# Altium schematic sheet Hdr2.SchDoc
size Letter; SheetNumber: 9; SheetTotal: 15
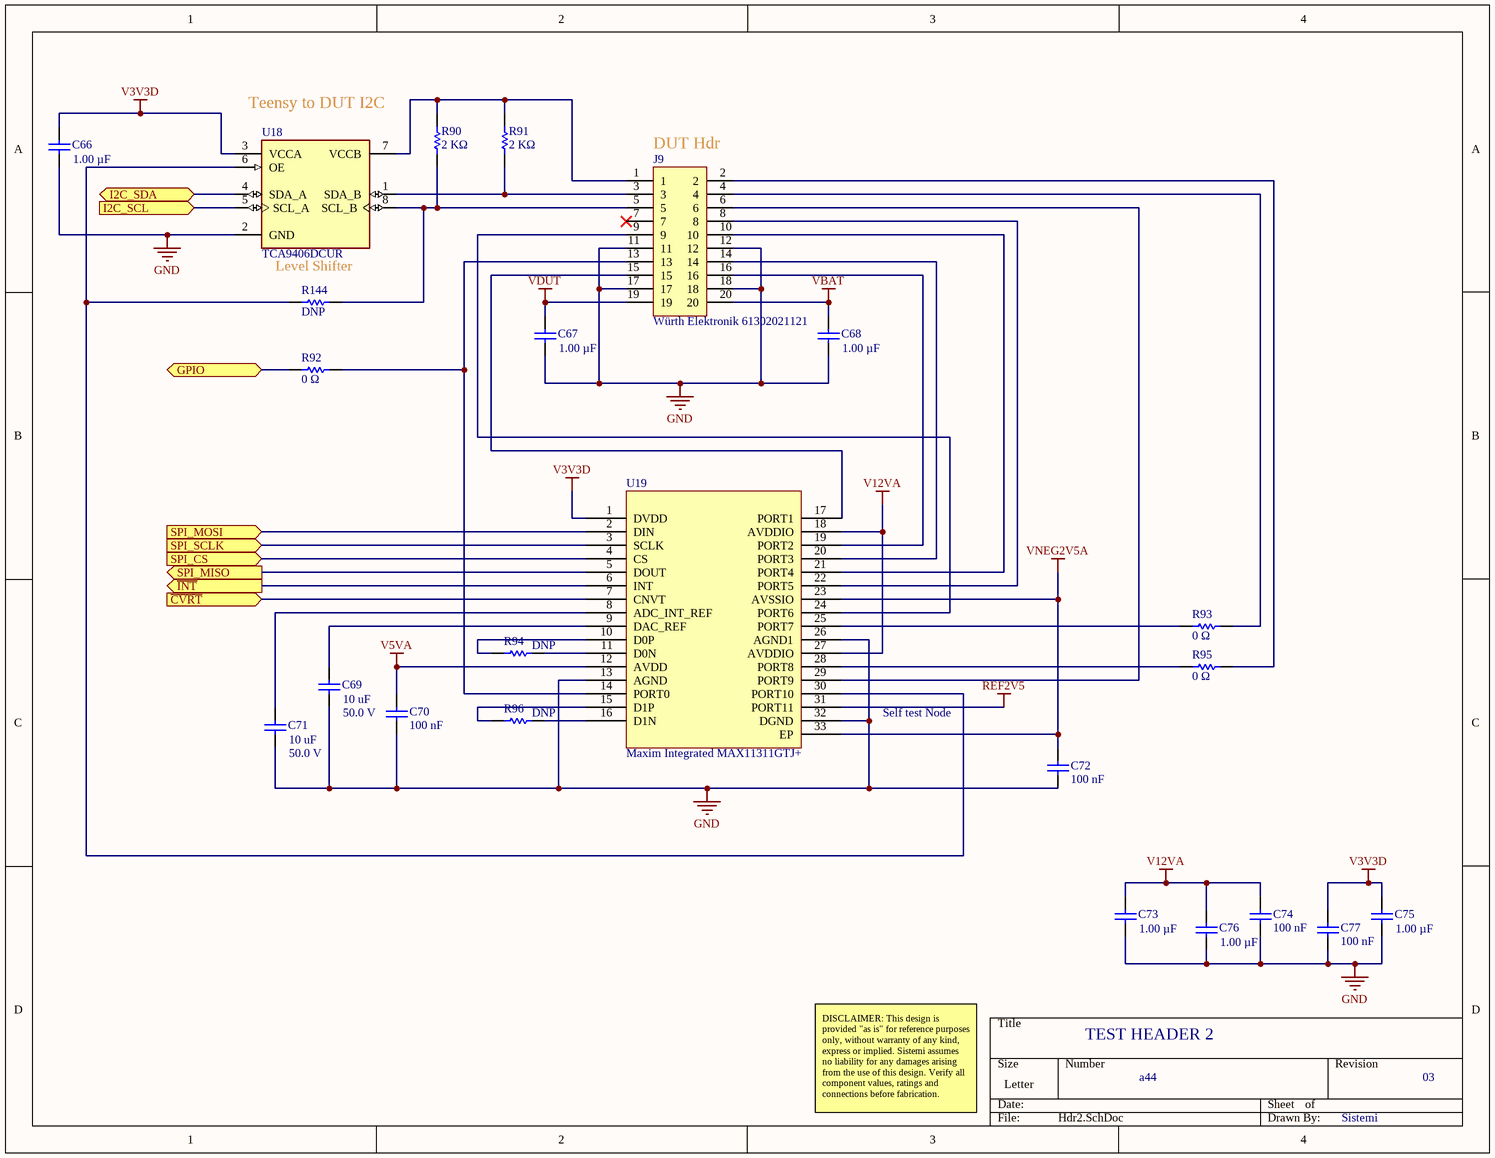
[diagram p0: Hdr2.SchDoc]

## Parts
C66  Capacitance: 1.00 µF  [CAPC1608X90X35NL15T15]  (hidden comment: Samsung CL10B105KA8NNNC)
C67  Capacitance: 1.00 µF  [CAPC1608X90X35NL15T15]  (hidden comment: Samsung CL10B105KA8NNNC)
C68  Capacitance: 1.00 µF  [CAPC1608X90X35NL15T15]  (hidden comment: Samsung CL10B105KA8NNNC)
C69  Capacitance: 10 uF  Voltage Rating (DC): 50.0 V  [CAPC3216X180X55LL20T25]  (hidden comment: Murata GRM31CR61H106KA12L)
C70  Capacitance: 100 nF  [CAPC1005X56X25NL10T15]  (hidden comment: Samsung CL05B104KO5NNNC)
C71  Capacitance: 10 uF  Voltage Rating (DC): 50.0 V  [CAPC3216X180X55LL20T25]  (hidden comment: Murata GRM31CR61H106KA12L)
C72  Capacitance: 100 nF  [CAPC1005X56X25NL10T15]  (hidden comment: Samsung CL05B104KO5NNNC)
C73  Capacitance: 1.00 µF  [CAPC1608X90X35NL15T15]  (hidden comment: Samsung CL10B105KA8NNNC)
C74  Capacitance: 100 nF  [CAPC1005X56X25NL10T15]  (hidden comment: Samsung CL05B104KO5NNNC)
C75  Capacitance: 1.00 µF  [CAPC1608X90X35NL15T15]  (hidden comment: Samsung CL10B105KA8NNNC)
C76  Capacitance: 1.00 µF  [CAPC1608X90X35NL15T15]  (hidden comment: Samsung CL10B105KA8NNNC)
C77  Capacitance: 100 nF  [CAPC1005X56X25NL10T15]  (hidden comment: Samsung CL05B104KO5NNNC)
J9  Würth Elektronik 61302021121  [PCB-nk6cd1c3p7lqby8wsdwb-1]
R90  Resistance: 2 KΩ  [RESC1608X55X30ML15T15]  (hidden comment: Generic RES 0603)
R91  Resistance: 2 KΩ  [RESC1608X55X30ML15T15]  (hidden comment: Generic RES 0603)
R92  Resistance: 0 Ω  [RESC1608X55X30ML15T15]  (hidden comment: Generic RES 0603)
R93  Resistance: 0 Ω  [RESC1608X55X30ML15T15]  (hidden comment: Generic RES 0603)
R94  Resistance: DNP  [RESC1608X55X30ML15T15]  (hidden comment: Generic RES 0603)
R95  Resistance: 0 Ω  [RESC1608X55X30ML15T15]  (hidden comment: Generic RES 0603)
R96  Resistance: DNP  [RESC1608X55X30ML15T15]  (hidden comment: Generic RES 0603)
R144  Resistance: DNP  [RESC1608X55X30ML15T15]  (hidden comment: Generic RES 0603)
U18  TCA9406DCUR  [DCU8_L]
U19  Maxim Integrated MAX11311GTJ+  [PCB-s1hzzxkmij8s4b201del-1]

## Ports
GPIO (bidir), I2C_SCL (in), I2C_SDA (bidir), SPI_CS (in), SPI_MISO (out), SPI_MOSI (in), SPI_SCLK (in), ~{CVRT} (in), ~{INT} (out)

## Nets
GND: C66.1 C67.1 C68.1 C69.1 C70.2 C71.1 C72.2 C73.1 C74.2 C75.1 C76.1 C77.2 J9.11 J9.12 J9.17 J9.18 U18.2(GND) U19.13(AGND) U19.26(AGND1) U19.32(DGND)
REF2V5: U19.31(PORT11)
V3V3D: C66.2 C75.2 C77.1 U18.3(VCCA) U19.1(DVDD)
V5VA: C70.1 U19.12(AVDD)
V12VA: C73.2 C74.1 C76.2 U19.18(AVDDIO) U19.27(AVDDIO)
VBAT: C68.2 J9.20
VDUT: C67.2 J9.19
VNEG2V5A: C72.1 U19.23(AVSSIO) U19.33(EP)
~{CVRT}: U19.7(CNVT) ; port ~{CVRT}
GPIO: R92.2 ; port GPIO
I2C_SCL: U18.5(SCL_A) ; port I2C_SCL
I2C_SDA: U18.4(SDA_A) ; port I2C_SDA
~{INT}: U19.6(INT) ; port ~{INT}
SPI_CS: U19.4(CS) ; port SPI_CS
SPI_MISO: U19.5(DOUT) ; port SPI_MISO
SPI_MOSI: U19.2(DIN) ; port SPI_MOSI
SPI_SCLK: U19.3(SCLK) ; port SPI_SCLK
NetC69_2: C69.2 U19.9(DAC_REF)
NetC71_2: C71.2 U19.8(ADC_INT_REF)
NetJ9_1: J9.1 R90.1 R91.1 U18.7(VCCB)
NetJ9_2: J9.2 R95.1
NetJ9_3: J9.3 R91.2 U18.1(SDA_B)
NetJ9_4: J9.4 R93.1
NetJ9_5: J9.5 R90.2 R144.1 U18.8(SCL_B)
NetJ9_6: J9.6 U19.29(PORT9)
NetJ9_8: J9.8 U19.22(PORT5)
NetJ9_9: J9.9 U19.24(PORT6)
NetJ9_10: J9.10 U19.21(PORT4)
NetJ9_13: J9.13 R92.1 U19.14(PORT0)
NetJ9_14: J9.14 U19.20(PORT3)
NetJ9_15: J9.15 U19.17(PORT1)
NetJ9_16: J9.16 U19.19(PORT2)
NetR93_2: R93.2 U19.25(PORT7)
NetR94_1: R94.1 U19.11(D0N)
NetR94_2: R94.2 U19.10(D0P)
NetR95_2: R95.2 U19.28(PORT8)
NetR96_1: R96.1 U19.16(D1N)
NetR96_2: R96.2 U19.15(D1P)
NetR144_2: R144.2 U18.6(OE) U19.30(PORT10)

Not connected (* = marked no-connect by the designer): J9 7*

## Notes on the sheet
- Teensy to DUT I2C
- (near J9) DUT Hdr
- Level Shifter
- Self test Node
- TEST HEADER 2
- DISCLAIMER: This design is provided "as is" for reference purposes only, without warranty of any kind, express or implied. Sistemi assumes no liability for any damages arising from the use of this design. Verify all component values, ratings and connections before fabrication.
- a44
- 03
- Sistemi

## Library data of the parts
C66-C68 C73 C75 C76 = CMP-7473528-5: CL Series 0603 1 uF 25 V ±10 % X7R Surface Mount Multilayer Ceramic Capacitor; Manufacturer Part Number: UMK107AB7105KA-T; Lead-Free Status: Lead Free; Capacitance Tolerance: ±10%; Voltage Rating (DC): 25.0 V; RoHS: Compliant; Mounting Style: Surface Mount; Footprint: PCB-0002-00062-3; Octopart URL: http://octopart.com/cl10b105ka8nnnc-samsung-19831597; Case/Package: 0603; OctopartID: ce7a065e703111bd; Dielectric Characteristic: X7R
C69 C71 = CMP-3554908-2: Multilayer Ceramic Capacitors MLCC - SMD/SMT 1206 10uF 50volt X5R +/-10%; Manufacturer Part Number: CL31B106KBHNNNE; Capacitance Tolerance: ±10%; Case/Package (SI): 3216; Lead-Free Status: Lead Free; Dielectric Characteristic: X5R; Lifecycle Status: Active; Mounting Style: Surface Mount; Number of Pins: 2; Octopart Url: https://octopart.com/grm31cr61h106ka12l-murata-18903335; OctopartID: fd8535afa9c42242; Packaging: Cut Tape (CT); REACH SVHC Compliance: No SVHC; RoHS: Compliant; Size-Length: 0.0032 m; Size-Thickness: 0.0016 m; Size-Width: 0.0016 m
C70 C72 C74 C77 = CMP-bf2276a55d9a60e5-19: Ceramic capacitor SMD-0402 100nF /16V X7R# K +-10%, Samsung, RoHS; Dielectric Characteristic: X7R; Lead-Free Status: Lead Free; Voltage Rating (DC): 16.0 V; Capacitance Tolerance: ±10%; Mounting Style: Surface Mount; Case/Package: 0402; OctopartID: 0755ced2c795d892; Footprint: PCB-0002-00476-3; Octopart URL: https://octopart.com/cl05b104ko5nnnc-samsung-9299366; RoHS: Compliant; Manufacturer Part Number: CL05B104KO5NNNC
J9 = CMP-005cc8a3733edf9b-7: THT Vertical Pin Header WR-PHD, Pitch 2.54 mm, Dual Row, 20 pins; Current Rating: 3.00 A; Dielectric Withstanding Voltage: 500 V; Pin Pitch: 2.54 mm; Operating Voltage: 250 V; Number of Contacts: 20; Contact Resistance: 20.0 mΩ; Gender: Male; Contact Material: Copper; Footprint: PCB-005cc8a3733edf9b-1; Mounting Style: Through Hole; Color: Black; Contact Plating: Gold; REACH SVHC Compliance: No SVHC; RoHS: Compliant; Octopart URL: https://octopart.com/61302021121-w%C3%BCrth+elektronik-32855556; Packaging: Bag; Orientation: Vertical; OctopartID: 005cc8a3733edf9b; Number of Pins: 20; Operating Temperature: -40.0 °C (min); Manufacturer Part Number: 61302021121
R90 R91 = CMP-0800c38b3cf2d7c7-3: Generic RES 0603, =Resistance+','+Tolerance+','+Case; Manufacturer Part Number: RE0603FRE072KL; Case/Package (SI): 1608; Lead-Free Status: Lead Free; Power Rating: 63.0 mW; Voltage: 50V; ELV Compliant: Compliant; Tolerance: ±1%; Temperature Coefficient: -50.0 ppm/°C to 50.0 ppm/°C; Octopart URL: TBD; Number of Pins: 2; Mounting Style: Surface Mount; Packaging: Tape & Reel (TR); Lifecycle Status: Active; RoHS: Compliant; Case: 0603; Operating Temperature: -55.0 °C to 125 °C; REACH SVHC Compliance: No SVHC; Footprint: PCB-0002-00066-3; OctopartID: a8e96364fc37772e
R92 R93 R95 = CMP-0800c38b3cf2d7c7-3: Generic RES 0603, =Resistance+','+Tolerance+','+Case; Manufacturer Part Number: CRCW06030000Z0EAC; Case/Package (SI): 1608; Lead-Free Status: Lead Free; Power Rating: 63.0 mW; Voltage: 50V; ELV Compliant: Compliant; Tolerance: ±1%; Temperature Coefficient: -50.0 ppm/°C to 50.0 ppm/°C; Octopart URL: TBD; Number of Pins: 2; Mounting Style: Surface Mount; Packaging: Tape & Reel (TR); Lifecycle Status: Active; RoHS: Compliant; Case: 0603; Operating Temperature: -55.0 °C to 125 °C; REACH SVHC Compliance: No SVHC; Footprint: PCB-0002-00066-3; OctopartID: a8e96364fc37772e
R94 R96 = CMP-0800c38b3cf2d7c7-3: Generic RES 0603, =Resistance+','+Tolerance+','+Case; Manufacturer Part Number: TBD; Case/Package (SI): 1608; Lead-Free Status: Lead Free; Power Rating: 63.0 mW; Voltage: 50V; ELV Compliant: Compliant; Tolerance: ±1%; Temperature Coefficient: -50.0 ppm/°C to 50.0 ppm/°C; Octopart URL: TBD; Number of Pins: 2; Mounting Style: Surface Mount; Packaging: Tape & Reel (TR); Lifecycle Status: Active; RoHS: Compliant; Case: 0603; Operating Temperature: -55.0 °C to 125 °C; REACH SVHC Compliance: No SVHC; Footprint: PCB-0002-00066-3; OctopartID: a8e96364fc37772e
R144 = CMP-0800c38b3cf2d7c7-3: Generic RES 0603, =Resistance+','+Tolerance+','+Case; Case/Package (SI): 1608; Lead-Free Status: Lead Free; Power Rating: 63.0 mW; Voltage: 50V; ELV Compliant: Compliant; Tolerance: ±1%; Temperature Coefficient: -50.0 ppm/°C to 50.0 ppm/°C; Octopart URL: TBD; Number of Pins: 2; Mounting Style: Surface Mount; Packaging: Tape & Reel (TR); Lifecycle Status: Active; RoHS: Compliant; Case: 0603; Operating Temperature: -55.0 °C to 125 °C; REACH SVHC Compliance: No SVHC; Footprint: PCB-0002-00066-3; OctopartID: a8e96364fc37772e
U18 = CMP-1164468-4: TCA9406 Dual Bidirectional 1-MHz I2C-BUS and SMBus Voltage Level-Translator, 1.65 to 3.6 V, -40 to 85 degC, 8-pin US8 (DCU), Green (RoHS & no Sb/Br); Lead-Free Status: Lead Free; Number of Outputs: 2; Manufacturer Part Number: TCA9406DCUR; Packaging: Cut Tape (CT); Lifecycle Status: Active; OctopartID: 2214ea378f96fdd3; REACH SVHC Compliance: No SVHC; Octopart Url: https://octopart.com/tca9406dcur-texas+instruments-19499236; RoHS: Compliant; Number of Pins: 8
U19 = CMP-2cd8e1e00624f31f-4: 12-channel 12-Bit ADC and 12-Bit DAC, Analog PIXI, 12-Port Programmable Mixed-Signal I/O; Channels: 12; Lead-Free Status: Lead Free; Sample Rate: 400 kHz; Range Options: 0 to 2.5V, ±5V, 0 to +10V, -10V; Supply Voltage (DC): 4.75 V (max), 5.25 V (min); Manufacturer Part Number: MAX11311GTJ+; Lifecycle Status: Not Listed by Manufacturer; Octopart URL: http://octopart.com/max11311gtj%2B-maxim+integrated-70389658; RoHS: Compliant; Number of Bits: 12; OctopartID: 2cd8e1e00624f31f; Package: TQFN-32; Resolution: 12-bit